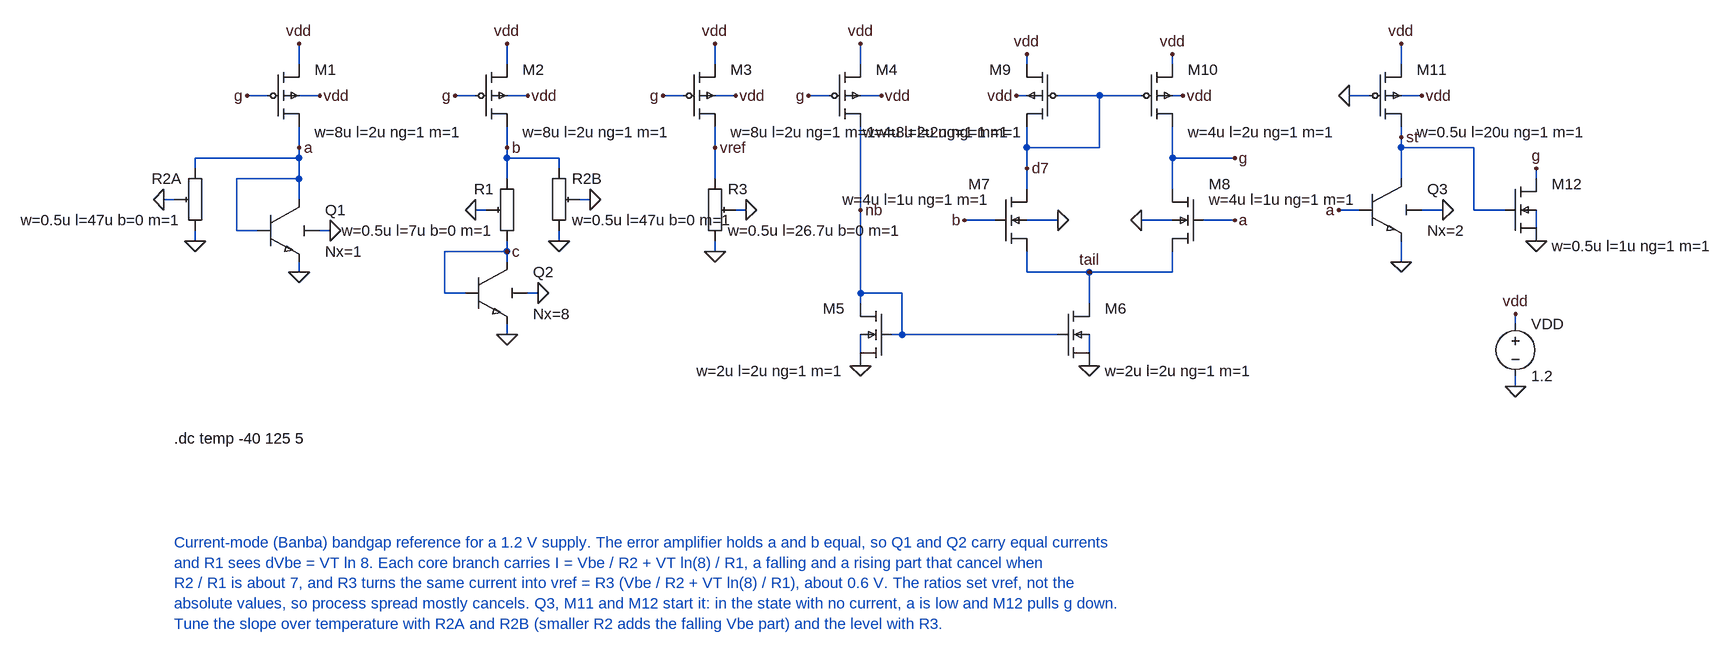
[diagram p0: schematic bandgap.asc]
bandgap.asc, the LTspice schematic file:
Version 4
SHEET 1 2300 1100
WIRE 240 96 240 64
WIRE 240 144 272 144
WIRE 192 144 160 144
WIRE 560 96 560 64
WIRE 560 144 592 144
WIRE 512 144 480 144
WIRE 880 96 880 64
WIRE 880 144 912 144
WIRE 832 144 800 144
WIRE 240 192 240 304
WIRE 240 400 240 416
WIRE 272 352 288 352
WIRE 176 352 144 352
WIRE 144 352 144 272
WIRE 144 272 240 272
WIRE 80 352 80 368
WIRE 48 304 32 304
WIRE 240 240 80 240
WIRE 80 240 80 256
WIRE 560 192 560 272
WIRE 528 320 512 320
WIRE 560 368 560 400
WIRE 560 496 560 512
WIRE 592 448 608 448
WIRE 496 448 464 448
WIRE 464 448 464 384
WIRE 464 384 560 384
WIRE 640 352 640 368
WIRE 672 304 688 304
WIRE 560 240 640 240
WIRE 640 240 640 256
WIRE 880 192 880 272
WIRE 880 368 880 384
WIRE 912 320 928 320
WIRE 1104 96 1104 64
WIRE 1104 144 1136 144
WIRE 1056 144 1024 144
WIRE 1104 192 1104 464
WIRE 1104 448 1168 448
WIRE 1168 448 1168 512
WIRE 1152 512 1408 512
WIRE 1360 96 1360 80
WIRE 1360 144 1344 144
WIRE 1584 96 1584 80
WIRE 1584 144 1600 144
WIRE 1408 144 1536 144
WIRE 1312 336 1264 336
WIRE 1360 336 1408 336
WIRE 1632 336 1680 336
WIRE 1584 336 1536 336
WIRE 1360 192 1360 288
WIRE 1360 224 1472 224
WIRE 1472 224 1472 144
WIRE 1584 192 1584 288
WIRE 1584 240 1680 240
WIRE 1360 384 1360 416
WIRE 1360 416 1584 416
WIRE 1584 416 1584 384
WIRE 1456 464 1456 416
WIRE 1104 512 1104 560
WIRE 1456 512 1456 560
WIRE 1936 96 1936 64
WIRE 1936 144 1968 144
WIRE 1888 144 1856 144
WIRE 1872 320 1840 320
WIRE 1936 368 1936 400
WIRE 1968 320 2000 320
WIRE 1936 192 1936 272
WIRE 2144 272 2144 256
WIRE 1936 224 2048 224
WIRE 2048 224 2048 320
WIRE 2048 320 2096 320
WIRE 2144 320 2144 368
WIRE 2112 496 2112 480
WIRE 2112 576 2112 592
FLAG 240 64 vdd
FLAG 272 144 vdd
FLAG 160 144 g
FLAG 560 64 vdd
FLAG 592 144 vdd
FLAG 480 144 g
FLAG 880 64 vdd
FLAG 912 144 vdd
FLAG 800 144 g
FLAG 240 224 a
FLAG 240 416 0
FLAG 288 352 0
FLAG 80 368 0
FLAG 32 304 0
FLAG 560 224 b
FLAG 512 320 0
FLAG 560 384 c
FLAG 560 512 0
FLAG 608 448 0
FLAG 640 368 0
FLAG 688 304 0
FLAG 880 224 vref
FLAG 880 384 0
FLAG 928 320 0
FLAG 1104 64 vdd
FLAG 1136 144 vdd
FLAG 1024 144 g
FLAG 1104 320 nb
FLAG 1360 80 vdd
FLAG 1344 144 vdd
FLAG 1584 80 vdd
FLAG 1600 144 vdd
FLAG 1264 336 b
FLAG 1408 336 0
FLAG 1680 336 a
FLAG 1536 336 0
FLAG 1360 256 d7
FLAG 1680 240 g
FLAG 1456 416 tail
FLAG 1104 560 0
FLAG 1456 560 0
FLAG 1936 64 vdd
FLAG 1968 144 vdd
FLAG 1856 144 0
FLAG 1840 320 a
FLAG 1936 400 0
FLAG 2000 320 0
FLAG 1936 208 st
FLAG 2144 256 g
FLAG 2144 368 0
FLAG 2112 480 vdd
FLAG 2112 592 0
SYMBOL sg13g2\sg13_lv_pmos 192 96 R0
WINDOW 0 72 8 Left 2
WINDOW 3 0 0 Invisible 2
WINDOW 39 72 104 Left 2
SYMATTR InstName M1
SYMATTR SpiceLine w=8u l=2u ng=1 m=1
SYMBOL sg13g2\sg13_lv_pmos 512 96 R0
WINDOW 0 72 8 Left 2
WINDOW 3 0 0 Invisible 2
WINDOW 39 72 104 Left 2
SYMATTR InstName M2
SYMATTR SpiceLine w=8u l=2u ng=1 m=1
SYMBOL sg13g2\sg13_lv_pmos 832 96 R0
WINDOW 0 72 8 Left 2
WINDOW 3 0 0 Invisible 2
WINDOW 39 72 104 Left 2
SYMATTR InstName M3
SYMATTR SpiceLine w=8u l=2u ng=1 m=1
SYMBOL sg13g2\npn13G2 176 304 R0
WINDOW 0 104 16 Left 2
WINDOW 3 0 0 Invisible 2
WINDOW 39 104 80 Left 2
SYMATTR InstName Q1
SYMATTR SpiceLine Nx=1
SYMBOL sg13g2\rhigh 96 256 M0
WINDOW 0 36 16 Left 2
WINDOW 3 0 0 Invisible 2
WINDOW 39 36 80 Left 2
SYMATTR InstName R2A
SYMATTR SpiceLine w=0.5u l=47u b=0 m=1
SYMBOL sg13g2\rhigh 576 272 M0
WINDOW 0 36 16 Left 2
WINDOW 3 0 0 Invisible 2
WINDOW 39 36 80 Left 2
SYMATTR InstName R1
SYMATTR SpiceLine w=0.5u l=7u b=0 m=1
SYMBOL sg13g2\npn13G2 496 400 R0
WINDOW 0 104 16 Left 2
WINDOW 3 0 0 Invisible 2
WINDOW 39 104 80 Left 2
SYMATTR InstName Q2
SYMATTR SpiceLine Nx=8
SYMBOL sg13g2\rhigh 624 256 R0
WINDOW 0 36 16 Left 2
WINDOW 3 0 0 Invisible 2
WINDOW 39 36 80 Left 2
SYMATTR InstName R2B
SYMATTR SpiceLine w=0.5u l=47u b=0 m=1
SYMBOL sg13g2\rhigh 864 272 R0
WINDOW 0 36 16 Left 2
WINDOW 3 0 0 Invisible 2
WINDOW 39 36 80 Left 2
SYMATTR InstName R3
SYMATTR SpiceLine w=0.5u l=26.7u b=0 m=1
SYMBOL sg13g2\sg13_lv_pmos 1056 96 R0
WINDOW 0 72 8 Left 2
WINDOW 3 0 0 Invisible 2
WINDOW 39 72 104 Left 2
SYMATTR InstName M4
SYMATTR SpiceLine w=8u l=2u ng=1 m=1
SYMBOL sg13g2\sg13_lv_nmos 1152 464 M0
WINDOW 0 72 8 Left 2
WINDOW 3 0 0 Invisible 2
WINDOW 39 72 104 Left 2
SYMATTR InstName M5
SYMATTR SpiceLine w=2u l=2u ng=1 m=1
SYMBOL sg13g2\sg13_lv_nmos 1408 464 R0
WINDOW 0 72 8 Left 2
WINDOW 3 0 0 Invisible 2
WINDOW 39 72 104 Left 2
SYMATTR InstName M6
SYMATTR SpiceLine w=2u l=2u ng=1 m=1
SYMBOL sg13g2\sg13_lv_pmos 1408 96 M0
WINDOW 0 72 8 Left 2
WINDOW 3 0 0 Invisible 2
WINDOW 39 72 104 Left 2
SYMATTR InstName M9
SYMATTR SpiceLine w=4u l=2u ng=1 m=1
SYMBOL sg13g2\sg13_lv_pmos 1536 96 R0
WINDOW 0 72 8 Left 2
WINDOW 3 0 0 Invisible 2
WINDOW 39 72 104 Left 2
SYMATTR InstName M10
SYMATTR SpiceLine w=4u l=2u ng=1 m=1
SYMBOL sg13g2\sg13_lv_nmos 1312 288 R0
WINDOW 0 -8 -8 Right 2
WINDOW 3 0 0 Invisible 2
WINDOW 39 -8 16 Right 2
SYMATTR InstName M7
SYMATTR SpiceLine w=4u l=1u ng=1 m=1
SYMBOL sg13g2\sg13_lv_nmos 1632 288 M0
WINDOW 0 -8 -8 Right 2
WINDOW 3 0 0 Invisible 2
WINDOW 39 -8 16 Right 2
SYMATTR InstName M8
SYMATTR SpiceLine w=4u l=1u ng=1 m=1
SYMBOL sg13g2\sg13_lv_pmos 1888 96 R0
WINDOW 0 72 8 Left 2
WINDOW 3 0 0 Invisible 2
WINDOW 39 72 104 Left 2
SYMATTR InstName M11
SYMATTR SpiceLine w=0.5u l=20u ng=1 m=1
SYMBOL sg13g2\npn13G2 1872 272 R0
WINDOW 0 104 16 Left 2
WINDOW 3 0 0 Invisible 2
WINDOW 39 104 80 Left 2
SYMATTR InstName Q3
SYMATTR SpiceLine Nx=2
SYMBOL sg13g2\sg13_lv_nmos 2096 272 R0
WINDOW 0 72 8 Left 2
WINDOW 3 0 0 Invisible 2
WINDOW 39 72 104 Left 2
SYMATTR InstName M12
SYMATTR SpiceLine w=0.5u l=1u ng=1 m=1
SYMBOL voltage 2112 480 R0
SYMATTR InstName VDD
SYMATTR Value 1.2
TEXT 48 672 Left 2 !.dc temp -40 125 5
TEXT 48 832 Left 2 ;Current-mode (Banba) bandgap reference for a 1.2 V supply. The error amplifier holds a and b equal, so Q1 and Q2 carry equal currents\nand R1 sees dVbe = VT ln 8. Each core branch carries I = Vbe / R2 + VT ln(8) / R1, a falling and a rising part that cancel when\nR2 / R1 is about 7, and R3 turns the same current into vref = R3 (Vbe / R2 + VT ln(8) / R1), about 0.6 V. The ratios set vref, not the\nabsolute values, so process spread mostly cancels. Q3, M11 and M12 start it: in the state with no current, a is low and M12 pulls g down.\nTune the slope over temperature with R2A and R2B (smaller R2 adds the falling Vbe part) and the level with R3.

The netlist it stands for:
* bandgap.asc
XM1 a g vdd vdd sg13_lv_pmos w=8u l=2u ng=1 m=1  ; pins D G S B
XM2 b g vdd vdd sg13_lv_pmos w=8u l=2u ng=1 m=1  ; pins D G S B
XM3 vref g vdd vdd sg13_lv_pmos w=8u l=2u ng=1 m=1  ; pins D G S B
XQ1 a a 0 0 npn13G2 Nx=1  ; pins C B E BN
XR2A a 0 0 rhigh w=0.5u l=47u b=0 m=1  ; pins P M BN
XR1 b c 0 rhigh w=0.5u l=7u b=0 m=1  ; pins P M BN
XQ2 c c 0 0 npn13G2 Nx=8  ; pins C B E BN
XR2B b 0 0 rhigh w=0.5u l=47u b=0 m=1  ; pins P M BN
XR3 vref 0 0 rhigh w=0.5u l=26.7u b=0 m=1  ; pins P M BN
XM4 nb g vdd vdd sg13_lv_pmos w=8u l=2u ng=1 m=1  ; pins D G S B
XM5 nb nb 0 0 sg13_lv_nmos w=2u l=2u ng=1 m=1  ; pins D G S B
XM6 tail nb 0 0 sg13_lv_nmos w=2u l=2u ng=1 m=1  ; pins D G S B
XM9 d7 d7 vdd vdd sg13_lv_pmos w=4u l=2u ng=1 m=1  ; pins D G S B
XM10 g d7 vdd vdd sg13_lv_pmos w=4u l=2u ng=1 m=1  ; pins D G S B
XM7 d7 b tail 0 sg13_lv_nmos w=4u l=1u ng=1 m=1  ; pins D G S B
XM8 g a tail 0 sg13_lv_nmos w=4u l=1u ng=1 m=1  ; pins D G S B
XM11 st 0 vdd vdd sg13_lv_pmos w=0.5u l=20u ng=1 m=1  ; pins D G S B
XQ3 st a 0 0 npn13G2 Nx=2  ; pins C B E BN
XM12 g st 0 0 sg13_lv_nmos w=0.5u l=1u ng=1 m=1  ; pins D G S B
VDD vdd 0 1.2
.dc temp -40 125 5
* Current-mode (Banba) bandgap reference for a 1.2 V supply. The error amplifier holds a and b equal, so Q1 and Q2 carry equal currents
* and R1 sees dVbe = VT ln 8. Each core branch carries I = Vbe / R2 + VT ln(8) / R1, a falling and a rising part that cancel when
* R2 / R1 is about 7, and R3 turns the same current into vref = R3 (Vbe / R2 + VT ln(8) / R1), about 0.6 V. The ratios set vref, not the
* absolute values, so process spread mostly cancels. Q3, M11 and M12 start it: in the state with no current, a is low and M12 pulls g down.
* Tune the slope over temperature with R2A and R2B (smaller R2 adds the falling Vbe part) and the level with R3.
.backanno
.end